# Altium schematic sheet Power_management.SchDoc: =DT_SCH_Title
size A3; Organization: Droid Technologies
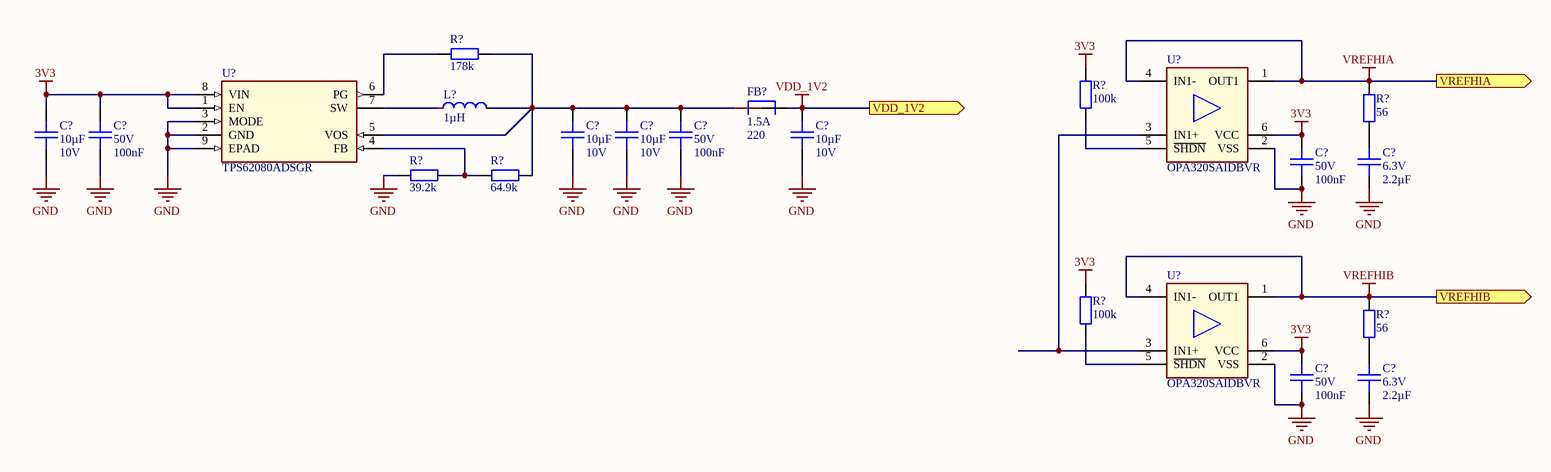
[diagram p0: Power_management.SchDoc]

## Parts
(Parts that share a designator on the sheet are numbered #1, #2 ... from top to bottom, then left to right.)
C?#1  Capacitance: 10µF  Voltage Rating: 10V  [CAPC200X125X145L50]  (hidden comment: CGA4J1X8L1A106K125AC)
C?#2  Voltage Rating: 50V  Capacitance: 100nF  [CAPC100x50x50L25]  (hidden comment: GCM155L8EH104KE07D)
C?#3  Capacitance: 10µF  Voltage Rating: 10V  [CAPC200X125X145L50]  (hidden comment: CGA4J1X8L1A106K125AC)
C?#4  Capacitance: 10µF  Voltage Rating: 10V  [CAPC200X125X145L50]  (hidden comment: CGA4J1X8L1A106K125AC)
C?#5  Voltage Rating: 50V  Capacitance: 100nF  [CAPC100x50x50L25]  (hidden comment: GCM155L8EH104KE07D)
C?#6  Capacitance: 10µF  Voltage Rating: 10V  [CAPC200X125X145L50]  (hidden comment: CGA4J1X8L1A106K125AC)
C?#7  Voltage Rating: 50V  Capacitance: 100nF  [CAPC100x50x50L25]  (hidden comment: GCM155L8EH104KE07D)
C?#8  Voltage Rating: 6.3V  Capacitance: 2.2µF  [CAPC160X80X90L35]  (hidden comment: C1608X8L0J225K080AC)
C?#9  Voltage Rating: 50V  Capacitance: 100nF  [CAPC100x50x50L25]  (hidden comment: GCM155L8EH104KE07D)
C?#10  Voltage Rating: 6.3V  Capacitance: 2.2µF  [CAPC160X80X90L35]  (hidden comment: C1608X8L0J225K080AC)
FB?  Imax: 1.5A  Impedance: 220  [BEADC160X80X95L40]  (hidden comment: BLM18KG221BH1D)
L?  Inductance: 1µH  [INDC250X200X120L60]  (hidden comment: DFE2HCAH1R0MJ0L)
R?#1  Resistance: 178k  [RESC100X50X40L25]  (hidden comment: RC0402FR-07178KL)
R?#2  Resistance: 100k  [RESC100X50X40L25]  (hidden comment: RC0402FR-07100KL)
R?#3  Resistance: 56  [RESC100X50X40L25]  (hidden comment: RC0402FR-0756RL)
R?#4  Resistance: 39.2k  [RESC100X50X40L25]  (hidden comment: RMCF0402FT39K2)
R?#5  Resistance: 64.9k  [RESC100X50X40L25]  (hidden comment: RC0402FR-0764K9L)
R?#6  Resistance: 100k  [RESC100X50X40L25]  (hidden comment: RC0402FR-07100KL)
R?#7  Resistance: 56  [RESC100X50X40L25]  (hidden comment: RC0402FR-0756RL)
U?#1  OPA320SAIDBVR  [SOT-23-6]
U?#2  TPS62080ADSGR  [WSON (8) 2*2mm]
U?#3  OPA320SAIDBVR  [SOT-23-6]

## Ports
VDD_1V2 (out), VREFHIA (out), VREFHIB (out)

## Nets
3V3: C?#1.2 C?#2.2 C?#7.2 C?#9.2 R?#2.2 R?#6.2 U?#1.6(VCC) U?#2.1(EN) U?#2.8(VIN) U?#3.6(VCC)
GND: C?#1.1 C?#2.1 C?#3.1 C?#4.1 C?#5.1 C?#6.1 C?#7.1 C?#8.1 C?#9.1 C?#10.1 R?#4.1 U?#1.2(VSS) U?#2.2(GND) U?#2.3(MODE) U?#2.9(EPAD) U?#3.2(VSS)
VDD_1V2: C?#6.2 FB?.2 ; port VDD_1V2
VREFHIA: R?#3.2 U?#1.1(OUT1) U?#1.4(IN1-) ; port VREFHIA
VREFHIB: R?#7.2 U?#3.1(OUT1) U?#3.4(IN1-) ; port VREFHIB
NetC?#3_2: C?#3.2 C?#4.2 C?#5.2 FB?.1 L?.2 R?#1.2 R?#5.2 U?#2.5(VOS)
NetC?#8_2: C?#8.2 R?#3.1
NetC?#10_2: C?#10.2 R?#7.1
NetL?_1: L?.1 U?#2.7(SW)
NetR?#1_1: R?#1.1 U?#2.6(PG)
NetR?#2_1: R?#2.1 U?#1.5(~{SHDN})
NetR?#4_2: R?#4.2 R?#5.1 U?#2.4(FB)
NetR?#6_1: R?#6.1 U?#3.5(~{SHDN})
NetU?#1_3: U?#1.3(IN1+) U?#3.3(IN1+)

## Notes on the sheet
- Title
- Size:
- A3
- Number:
- Revision:
- Date:
- Time:
- Sheet
- of

## Library data of the parts
C?#1 C?#3 C?#4 C?#6 = CMP-001-1984-1: CAP CER 10UF 10V X8L 0805; Manufacturer: TDK Corporation; Tolerance: 10%; Op Temp min: -55°C; Op Temp max: 150°C; ComponentLink3Description: Digikey; Mounting Type: SM; Ratings: AEC-Q200; ComponentLink1Description: Datasheet; ComponentLink3URL: https://www.digikey.com/en/products/detail/tdk-corporation/CGA4J1X8L1A106K125AC/9991388; Lead Spacing: 0mm; MPN: CGA4J1X8L1A106K125AC; Size: 2.00mm x 1.25mm; Height max: 1.5mm; ComponentLink2URL: https://eu.mouser.com/ProductDetail/TDK/CGA4J1X8L1A106K125AC?qs=gZXFycFWdANzH%252B2UvJJjtQ%3D%3D; Package: 0805 (2012 Metric); ComponentLink2Description: Mouser; Dielectric: X8L; ComponentLink1URL: https://product.tdk.com/system/files/dam/doc/product/capacitor/ceramic/mlcc/catalog/mlcc_automotive_hightemp_en.pdf
C?#2 C?#5 C?#7 C?#9 = CMP-001-1980-1: CAP CER 0.1UF 50V X8L 0402; Manufacturer: Murata Electronics; Op Temp max: 150°C; Op Temp min: -55°C; Tolerance: 10%; Height max: 550µm; ComponentLink3Description: Digikey; Mounting Type: SM; ComponentLink3URL: https://www.digikey.com/en/products/detail/murata-electronics/GCM155L8EH104KE07D/11618823; Package: 0402 (1005 Metric); Lead Spacing: 0mm; MPN: GCM155L8EH104KE07D; Size: 1.00mm x 0.50mm; Ratings: AEC-Q200; ComponentLink1URL: https://search.murata.co.jp/Ceramy/image/img/A01X/G101/ENG/GCM155L8EH104KE07-01.pdf; ComponentLink1Description: Datasheet; Dielectric: X8L; ComponentLink2Description: Mouser; ComponentLink2URL: https://eu.mouser.com/ProductDetail/Murata-Electronics/GCM155L8EH104KE07D?qs=1mbolxNpo8fQSHf0HYnZWw%3D%3D
C?#8 C?#10 = CMP-001-2044-1: CAP CER 2.2UF 6.3V X8L 0603; Manufacturer: TDK Corporation; Op Temp min: -55°C; Tolerance: 10%; Op Temp max: 150°C; ComponentLink1URL: https://product.tdk.com/en/search/capacitor/ceramic/mlcc/info?part_no=C1608X8L0J225K080AC; MPN: C1608X8L0J225K080AC; ComponentLink3URL: https://www.digikey.com/en/products/detail/tdk-corporation/C1608X8L0J225K080AC/8343784; ComponentLink1Description: Datasheet; Lead Spacing: 0mm; ComponentLink3Description: Digikey; Package: 0603 (1608 Metric); Height max: 900µm; Size: 1.60mm x 0.80mm; Dielectric: X8L; Ratings: -; Mounting Type: SM; ComponentLink2URL: https://eu.mouser.com/ProductDetail/TDK/C1608X8L0J225K080AC?qs=rrS6PyfT74dgREMaiAoT3Q%3D%3D; ComponentLink2Description: Mouser
FB? = CMP-001-1981-1: FERRITE BEAD 220 OHM 0603 1LN; Manufacturer: Murata Electronics; DCR: 50m; Op Temp min: -55°C; Frequency: 100MHz; Op Temp max: 150°C; Number of Lines: 1; Mounting Type: SM; Size: 1.60mm x 0.80mm; ComponentLink2URL: https://eu.mouser.com/ProductDetail/Murata-Electronics/BLM18KG221BH1D?qs=sJ5gq5MLFXpgEHYBdWUtkQ%3D%3D; ComponentLink1Description: Datasheet; ComponentLink1URL: https://www.murata.com/en-us/products/productdata/8798137286686/QNFA9129.pdf; Lead Spacing: 0mm; Ratings: AEC-Q200; ComponentLink3Description: Digikey; ComponentLink3URL: https://www.digikey.com/en/products/detail/murata-electronics/BLM18KG221BH1D/6156000; Height max: 950µm; Package: 0603 (1608 Metric); ComponentLink2Description: Mouser; MPN: BLM18KG221BH1D
L? = CMP-001-2041-1: FIXED IND 1UH 3A 50 MOHM SMD; Manufacturer: Murata Electronics; Fsr: 79MHz; Shielding: Shielded; Material - Core: Metal; DCR: 50m; Type: Drum Core, Wirewound; Op Temp min: -40°C; Isat: 3.4A; Tolerance: 20%; Op Temp max: 150°C; Height max: 1.2mm; I: 3A; ComponentLink1URL: https://www.murata.com/en-us/products/productdetail?partno=DFE2HCAH1R0MJ0%23; ComponentLink1Description: Datasheet; Lead Spacing: 0mm; ComponentLink3URL: https://www.digikey.com/en/products/detail/murata-electronics/DFE2HCAH1R0MJ0L/10135180; ComponentLink2URL: https://eu.mouser.com/ProductDetail/Murata-Electronics/DFE2HCAH1R0MJ0L?qs=17u8i%2FzlE8%2FsfvqDr48AMQ%3D%3D; Ratings: AEC-Q200; ComponentLink3Description: Digikey; Package: 1008 (2520 Metric); ComponentLink2Description: Mouser; MPN: DFE2HCAH1R0MJ0L; Size: 2.50mm x 2.00mm; Mounting Type: SM
R?#1 = CMP-00630-3: RES 178K OHM 1% 1/16W 0402; Manufacturer: YAGEO; Temperature Coefficient: ±100ppm; Power: 63mW; Op Temp min: -55°C; Op Temp max: 155°C; Size: 1.00mm x 0.50mm; Composition: Thick Film; ComponentLink3URL: https://www.digikey.com/en/products/detail/yageo/RC0402FR-07178KL/5280870?s=N4IgTCBcDaIEoGEAMAWJYBicC0SDsAjHgBwDSAMiALoC%2BQA; Tolerance: 1%; Package: 0402 (1005 Metric); ComponentLink3Description: Digikey; ComponentLink1Description: Datasheet; MPN: RC0402FR-07178KL; Mounting Type: SM; Ratings: -; ComponentLink1URL: https://www.yageo.com/upload/media/product/productsearch/datasheet/rchip/PYu-RC_Group_51_RoHS_L_12.pdf; ComponentLink2URL: https://eu.mouser.com/ProductDetail/YAGEO/RC0402FR-07178KL?qs=UOUeRUa%252B8WmEoK18p4ojZQ%3D%3D; Height max: 400µm; ComponentLink2Description: Mouser
R?#2 R?#6 = CMP-00121-6: RES 100K OHM 1% 1/16W 0402; Manufacturer: YAGEO; Op Temp min: -55°C; Op Temp max: 155°C; Power: 63mW; Temperature Coefficient: ±100ppm; ComponentLink2Description: Mouser; Mounting Type: SM; Composition: Thick Film; ComponentLink3URL: https://www.digikey.com/en/products/detail/yageo/RC0402FR-07100KL/726526; Size: 1.00mm x 0.50mm; MPN: RC0402FR-07100KL; Tolerance: 1%; Ratings: -; ComponentLink1Description: Datasheet; ComponentLink2URL: https://eu.mouser.com/ProductDetail/YAGEO/RC0402FR-07100KL?qs=%2Fha2pyFaduhjtLcYvKXQ8IUndG0u%252BuCx1gxMxvN%252Btd7iB7mgHWsSbw%3D%3D; Package: 0402 (1005 Metric); ComponentLink1URL: https://www.yageo.com/upload/media/product/productsearch/datasheet/rchip/PYu-RC_Group_51_RoHS_L_12.pdf; ComponentLink3Description: Digikey; Height max: 400µm
R?#3 R?#7 = CMP-001-0492-6: RES 56 OHM 1% 1/16W 0402; Manufacturer: YAGEO; Op Temp min: -55°C; Temperature Coefficient: ±100ppm; Power: 63mW; Op Temp max: 155°C; Size: 1.00mm x 0.50mm; Mounting Type: SM; Height max: 400mm; ComponentLink3Description: Digikey; Tolerance: 1%; Ratings: -; MPN: RC0402FR-0756RL; ComponentLink1URL: https://www.yageo.com/upload/media/product/productsearch/datasheet/rchip/PYu-RC_Group_51_RoHS_L_12.pdf; ComponentLink3URL: https://www.digikey.com/en/products/detail/yageo/RC0402FR-0756RL/726636; ComponentLink2Description: Mouser; Composition: Thick Film; ComponentLink2URL: https://eu.mouser.com/ProductDetail/YAGEO/RC0402FR-0756RL?qs=V1yeUXFNrkmJal7VE1rFjw%3D%3D; ComponentLink1Description: Datasheet; Package: 0402 (1005 Metric)
R?#4 = CMP-001-2043-1: RES 39.2K OHM 1% 1/16W 0402; Manufacturer: Stackpole Electronics Inc; Op Temp min: -55°C; Temperature Coefficient: ±100ppm; Power: 63mW; Op Temp max: 155°C; ComponentLink1Description: Datasheet; Composition: Thick Film; ComponentLink1URL: https://www.seielect.com/catalog/sei-rmcf_rmcp.pdf; Package: 0402 (1005 Metric); ComponentLink3Description: Digikey; Tolerance: 1%; ComponentLink2Description: Mouser; MPN: RMCF0402FT39K2; Height max: 400µm; Ratings: AEC-Q200; ComponentLink2URL: https://eu.mouser.com/ProductDetail/SEI-Stackpole/RMCF0402FT39K2?qs=IPgv5n7u5QZ19xDSJPwVdQ%3D%3D; ComponentLink3URL: https://www.digikey.com/en/products/detail/stackpole-electronics-inc/RMCF0402FT39K2/1761390; Mounting Type: SM; Size: 1.00mm x 0.50mm
R?#5 = CMP-00721-2: RES 64.9K OHM 1% 1/16W 0402; Manufacturer: YAGEO; Temperature Coefficient: ±100ppm; Op Temp min: -55°C; Power: 63mW; Op Temp max: 155°C; Tolerance: 1%; Package: 0402 (1005 Metric); ComponentLink2URL: https://eu.mouser.com/ProductDetail/YAGEO/RC0402FR-0764K9L?qs=Is6ZsIPfHkbVUkOpst8WdA%3D%3D; MPN: RC0402FR-0764K9L; ComponentLink1URL: https://www.yageo.com/upload/media/product/productsearch/datasheet/rchip/PYu-RC_Group_51_RoHS_L_12.pdf; ComponentLink2Description: Mouser; ComponentLink3Description: Digikey; ComponentLink3URL: https://www.digikey.com/en/products/detail/yageo/RC0402FR-0764K9L/726649?s=N4IgTCBcDaIEoGEAMAWJYBicC0SDsAbCgNICcAMiALoC%2BQA; Composition: Thick Film; ComponentLink1Description: Datasheet; Mounting Type: SM; Ratings: -; Size: 1.00mm x 0.50mm; Height max: 400µm
U?#1 U?#3 = OPA320SAIDBVR: CMOS Amplifier 1 Circuit Rail-to-Rail SOT-23-6; Manufacturer: Texas Instruments; MPN: OPA320SAIDBVR
U?#2 = TPS62080ADSGR: IC REG BUCK ADJ 1.2A 8WSON; Manufacturer: Texas Instruments; MPN: TPS62080ADSGR